# Altium schematic sheet CAN.SchDoc
size A4; SheetNumber: 4; SheetTotal: 5
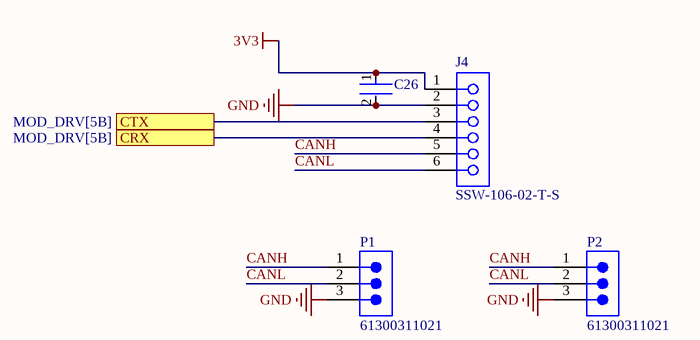
[diagram p0: CAN.SchDoc]

## Parts
C26  GCD21BR72A104MA01L  [FP-GCD21B-0_15-MFG]  (value not drawn)
J4  SSW-106-02-T-S  [SMTC-SSW-106-02-X-S]
P1  61300311021  [61300311021]
P2  61300311021  [61300311021]

## Ports
CRX (see MOD_DRV[5B]), CTX (see MOD_DRV[5B])

## Nets
3V3: C26.1 J4.1
GND: C26.2 J4.2 P1.3 P2.3
CANH: J4.5 P1.1 P2.1
CANL: J4.6 P1.2 P2.2
CRX: J4.4 ; port CRX
CTX: J4.3 ; port CTX

## Library data of the parts
C26 = CMP-06035-062053-1: Chip Multilayer Ceramic Capacitors for Automotive, 0805, 0.10uF, X7R, 15%, 20%, 100V, Grade 1
J4 = CMP-1023-00360-1: SQ Post Socket, Through-hole, Vertical, -55 to 105 degC, 2.54mm Pitch, 6-Pin, Female, RoHS; Manufacturer: Samtec; ComponentLink1URL: http://www.samtec.com; Temperature Range: -55 to 105 degC; Pitch: 2.54 mm; Mounting Technology: Through-hole; DatasheetVersion: F-214; ComponentLink1Description: Manufacturer URL; PackageVersion: CA, 6/1987; ComponentLink3Description: Package Specification; PackageDescription: Assembly, Socket Strip .016 X .031 Tail; ComponentLink2Description: Datasheet; ComponentLink2URL: http://www.samtec.com/documents/webfiles/pdf/SSW_TH.PDF; PackageReference: SSW-106-02-X-S; ComponentLink3URL: http://www.samtec.com/documents/webfiles/cpdf/SSW-1XX-XX-XXX-X-XX-XXX-XX-MKT.pdf; RoHS: True; PartNumber: SSW-106-02-T-S; Orientation: Vertical
P1 P2 = CMP-1502-01061-4: THT Angled Pin Header WR-PHD, Pitch 2.54 mm, Single Row, 3 pins; Contact Resistance: 20mΩ; Number of Positions: 3; Operating Supply Voltage: 250V; Connector Type: Male Pin; Gender: Male; Current Rating: 3A; Pitch: 2.54mm; Number of Pins: 3; Lead Pitch: 2.54mm; Mount: Through Hole; Contact Material: Copper; Contact Plating: Gold; Color: Black; Number of Contacts: 3; Packaging: Bulk; Contact Mating Length: 5.9944mm; Number of Rows: 1; Termination: Solder; RoHS: Compliant